# Altium schematic sheet ffultra_IMU.SchDoc
size A4; SheetNumber: 4; SheetTotal: 13
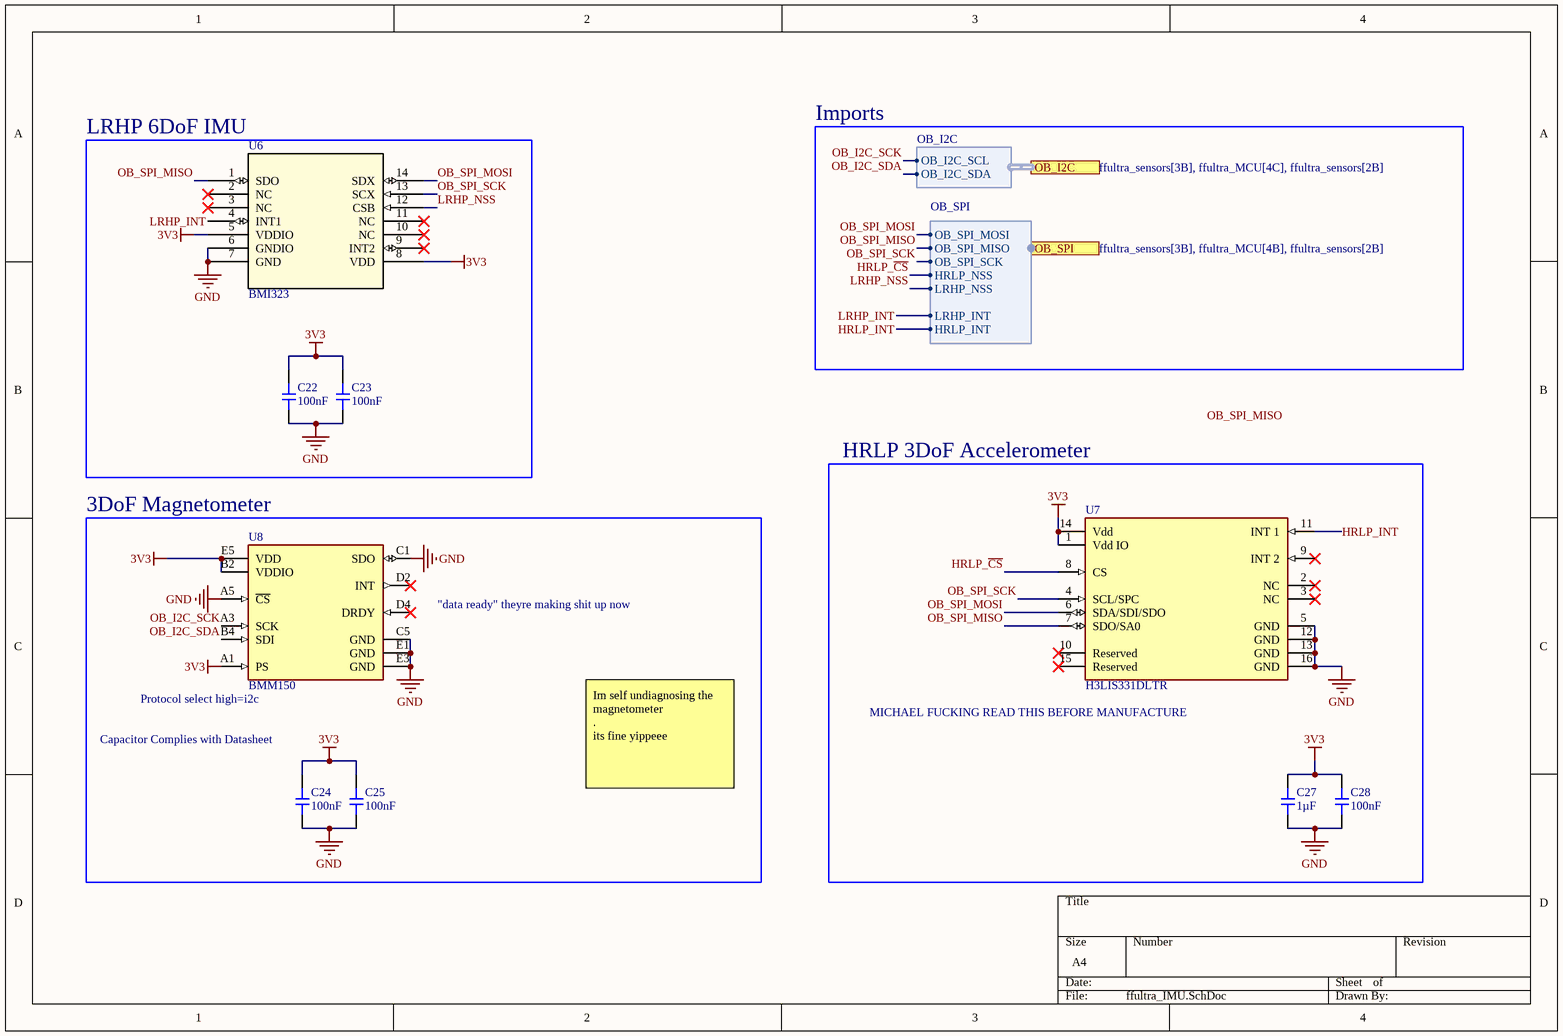
[diagram p0: ffultra_IMU.SchDoc]

## Parts
C22  value 100nF  [CAP-0402]  (hidden comment: CL05B104KO5NNNC)
C23  value 100nF  [CAP-0402]  (hidden comment: CL05B104KO5NNNC)
C24  value 100nF  [CAP-0402]  (hidden comment: CL05B104KO5NNNC)
C25  value 100nF  [CAP-0402]  (hidden comment: CL05B104KO5NNNC)
C27  value 1µF  [CAP-0402]  (hidden comment: CL05A105KA5NQNC)
C28  value 100nF  [CAP-0402]  (hidden comment: CL05B104KO5NNNC)
U6  BMI323  [BMI323_BOS]
U7  H3LIS331DLTR  [FP-TFLGA16-7983231-MFG]
U8  BMM150  [FP-BMM150-IPC_B]

## Blocks framed on the sheet
LRHP 6DoF IMU: C22 C23 U6
3DoF Magnetometer: C24 C25 U8
HRLP 3DoF Accelerometer: C27 C28 U7

## Ports
OB_I2C (harness OB_I2C, see ffultra_sensors[3B], ffultra_MCU[4C], ffultra_sensors[2B]), OB_SPI (harness OB_SPI, see ffultra_sensors[3B], ffultra_MCU[4B], ffultra_sensors[2B])

## Harnesses
OB_I2C: OB_I2C_SCL, OB_I2C_SDA
OB_SPI: OB_SPI_MOSI, OB_SPI_MISO, OB_SPI_SCK, HRLP_INT, LRHP_NSS, HRLP_NSS, LRHP_INT

## Nets
3V3: C22.2 C23.2 C24.2 C25.1 C27.2 C28.2 U6.5(VDDIO) U6.8(VDD) U7.1(Vdd_IO) U7.14(Vdd) U8.A1(PS) U8.B2(VDDIO) U8.E5(VDD)
GND: C22.1 C23.1 C24.1 C25.2 C27.1 C28.1 U6.6(GNDIO) U6.7(GND) U7.5(GND) U7.12(GND) U7.13(GND) U7.16(GND) U8.A5(~{CS}) U8.C1(SDO) U8.C5(GND) U8.E1(GND) U8.E3(GND)
HRLP_~{CS}: U7.8(CS) ; port OB_SPI.HRLP_NSS
HRLP_INT: U7.11(INT_1) ; port OB_SPI.HRLP_INT
LRHP_INT: U6.4(INT1) ; port OB_SPI.LRHP_INT
LRHP_NSS: U6.12(CSB) ; port OB_SPI.LRHP_NSS
OB_I2C_SCK: U8.A3(SCK) ; port OB_I2C.OB_I2C_SCL
OB_I2C_SDA: U8.B4(SDI) ; port OB_I2C.OB_I2C_SDA
OB_SPI_MISO: U6.1(SDO) U7.7(SDO/SA0) ; port OB_SPI.OB_SPI_MISO
OB_SPI_MOSI: U6.14(SDX) U7.6(SDA/SDI/SDO) ; port OB_SPI.OB_SPI_MOSI
OB_SPI_SCK: U6.13(SCX) U7.4(SCL/SPC) ; port OB_SPI.OB_SPI_SCK

Not connected (* = marked no-connect by the designer): U6 2(NC)* 3(NC)* 9(INT2)* 10(NC)* 11(NC)*; U7 2(NC)* 3(NC)* 9(INT_2)* 10(Reserved)* 15(Reserved)*; U8 D2(INT)* D4(DRDY)*

## Notes on the sheet
- Imports
- "data ready" theyre making shit up now
- (near U8) Protocol select high=i2c
- (near U7) MICHAEL FUCKING READ THIS BEFORE MANUFACTURE
- (near C24) Capacitor Complies with Datasheet
- Im self undiagnosing the magnetometer                          .                                            its fine yippeee
- Labels drawn without touching a wire or pin: OB_SPI_MISO

## Library data of the parts
C22-C25 C28 = CMP-001-00142-1: Capacitor, Ceramic (MLCC), 100nF, ±10%, 16V, X7R, ±10%, SMD 0402; Manufacturer: Samsung Electro-Mechanics; Design Item ID: CL05B104KO5NNNC; Source: jlcpcb_capacitors_basic.schlib; ComponentLink2URL: https://jlcpcb.com/partdetail/C1525; Voltage Rating: 16V; Tolerance: 10%; Temperature Coefficient: X7R; ComponentLink2Description: JLCPCB Part URL; ComponentLink1URL: https://datasheet.lcsc.com/lcsc/1810191219_Samsung-Electro-Mechanics-CL05B104KO5NNNC_C1525.pdf; JLCPCB Basic Part: Yes; JLCPCB Part Number: C1525; ComponentLink3URL: https://lcsc.com/product-detail/Multilayer-Ceramic-Capacitors-MLCC---SMD-SMT_Samsung-Electro-Mechanics-Samsung-Electro-Mechanics-CL05B104KO5NNNC_C1525.html; Manufacturer Part Number: CL05B104KO5NNNC; ComponentLink1Description: Datasheet; Case/Package: 0402; RoHS: Yes; Category: Capacitors - MLCC; ComponentLink3Description: LCSC Part URL
C27 = CMP-001-00135-1: Capacitor, Ceramic (MLCC), 1uF, ±10%, 25V, X5R, ±10%, SMD 0402; Manufacturer: Samsung Electro-Mechanics; Voltage Rating: 25V; RoHS: Yes; Temperature Coefficient: X5R; Tolerance: 10%; Source: jlcpcb_capacitors_basic.schlib; ComponentLink1URL: https://datasheet.lcsc.com/lcsc/1811091611_Samsung-Electro-Mechanics-CL05A105KA5NQNC_C52923.pdf; JLCPCB Basic Part: Yes; ComponentLink1Description: Datasheet; ComponentLink2URL: https://jlcpcb.com/partdetail/C52923; Case/Package: 0402; ComponentLink3Description: LCSC Part URL; Manufacturer Part Number: CL05A105KA5NQNC; ComponentLink3URL: https://lcsc.com/product-detail/Multilayer-Ceramic-Capacitors-MLCC---SMD-SMT_Samsung-Electro-Mechanics-Samsung-Electro-Mechanics-CL05A105KA5NQNC_C52923.html; Design Item ID: CL05A105KA5NQNC; JLCPCB Part Number: C52923; ComponentLink2Description: JLCPCB Part URL; Category: Capacitors - MLCC
U6 = CMP-157-000000-2: No Description Available; Mfr_Name: Bosch Sensortec; Type: Type; Source: BMI323.SchLib; Design Item ID: BMI323; RefDes: RefDes; JLCPCB Part Number: C5368700
U7 = CMP-010-00039-1: H3LIS331DL Series 3.6 V ±100/±200/±400 g 3-Axis Digital Accelerometer - TFLGA-16; Min Supply Voltage: 2.16V; Resolution: 2B; Sensor Type: 3 Axis; Operating Supply Voltage: 2.5V; Interface: I2C, SPI; Bandwidth: 500Hz; Number of Circuits: 1; Max Supply Voltage: 3.6V; Axis: X, Y, Z; Min Operating Temperature: -40°C; Height: 1mm; Temperature Grade: Industrial; Packaging: Cut Tape; Length: 3mm; Radiation Hardening: No; Lead Free: Lead Free; Height - Seated (Max): 1mm; Mounting Technology: Surface Mount; Max Operating Temperature: 85°C; Case/Package: LGA; Number of Terminals: 16; Output Type: Digital; Depth: 3mm; Nominal Supply Voltage (DC): 2.5V; Lifecycle Status: Production; Schedule B: 8542390000, 8542390000; Width: 3mm; Pins: 16; RoHS: Compliant; Terminal Pitch: 500µm; REACH SVHC: Unaffected; China RoHS: Non-Compliant
U8 = CMP-010-00038-1: Board Mount Hall Effect / Magnetic Sensors 3-Axis 1.56x1.56mm WLCSP-12 Geomagnetic; Max Supply Voltage: 3.6V; Min Supply Voltage: 1.2V; Output Type: I2C, SPI; Sensing Method: Hall Effect; Height: 595µm; Min Operating Temperature: -40°C; RoHS: Compliant; Case/Package: SMD/SMT; Ambient Temperature Range High: 85°C; Operating Supply Voltage: 3.6V; Max Operating Temperature: 85°C